# Altium schematic sheet Sensor2_MS5611.SchDoc: Sensors - Barometer 2 MS5611 (SPI5)
size A3; ApprovedBy: Weymen Koo; CheckedBy: -; DrawnBy: Weymen Koo; DocumentNumber: UBCAD-FCSOM-SCH; Revision: A; SheetNumber: 8; SheetTotal: 18; ProjectTitle: Flight Controller SoM; Status: PRELIMINARY; ReleaseDate: 2026-11-14
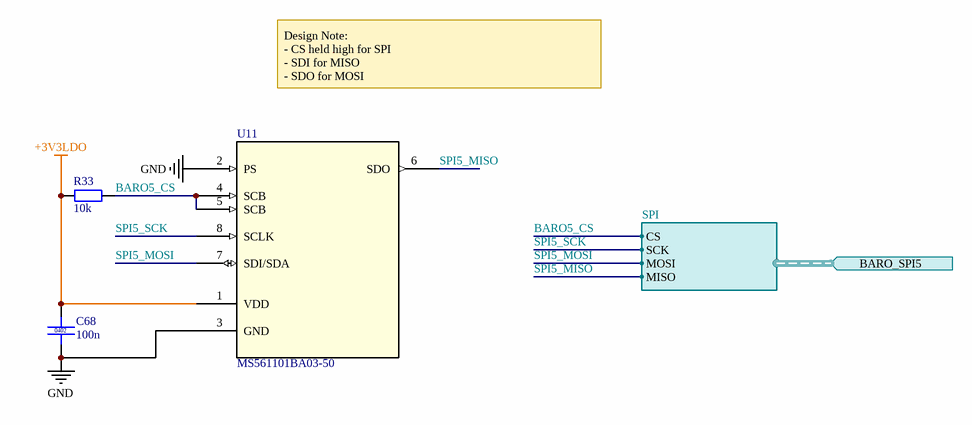
[diagram p0: Sensor2_MS5611.SchDoc]

## Parts
C68  100n  [CAPC1005X05N]
R33  10k  [IPC C R0402 NO SILK]
U11  MS561101BA03-50  [SON8_MS5611_TEC]

## Ports
BARO_SPI5 (in, harness SPI, see 1[5B], 4[5C])

## Harnesses
SPI: CS, SCK, MOSI, MISO

## Nets
+3V3LDO: C68.1 R33.1 U11.1(VDD)
GND: C68.2 U11.2(PS) U11.3(GND)
BARO5_CS: R33.2 U11.4(SCB) U11.5(SCB) ; port BARO_SPI5.CS
SPI5_MISO: U11.6(SDO) ; port BARO_SPI5.MISO
SPI5_MOSI: U11.7(SDI/SDA) ; port BARO_SPI5.MOSI
SPI5_SCK: U11.8(SCLK) ; port BARO_SPI5.SCK

## Notes on the sheet
- Design Note:
  - CS held high for SPI
  - SDI for MISO
  - SDO for MOSI
  - SCLK for SCK
- PROJECT
- KEY
- POWER
- 5 V class
- 3.3 V class
- Core / SMPS
- GND
- SHEET TITLE
- SIGNALS
- NOTES
- SPI
- Analog
- Design
- I2C
- PWM/Timer
- Layout
- UART/RC
- GPIO/Ctrl
- Assembly
- CAN
- Unused pin
- Firmware
- USB/SD/Clk
- Critical
- DRAWN
- DOCUMENT NO.
- CHECKED
- REV
- STATUS
- APPROVED
- DATE
- FILE
- SIZE
- A3
- SHEET
- of

## Library data of the parts
C68 = CMP-002-000094-5: CAP 100n 16V X7R 10% 0402; Manufacturer: Samsung; Manufacturer Part Number: CL05B104KO5NNNC; Value: 100n; Tolerance: 10%; Package: 0402; Voltage: 16V; Dielectric: X7R; LCSC Part #: C1525
R33 = CMP-008-000000-2: RES 10k 1% 1/16W 0402; Manufacturer: UNI-ROYAL; Manufacturer Part Number: 0402WGF1002TCE; Value: 10k; Source: Schlib1.SchLib; Design Item ID: Generic RES 0402; Package: 0402; Tolerance: 1%; Power: 1/16W; LCSC Part #: C25744
U11 = CMP-325-000000-2: MS5611 BAROMETRIC SENSOR CM T&R; Manufacturer_Name: TE Connectivity; Copyright: Copyright (C) 2026 Ultra Librarian. All rights reserved.; Design Item ID: MS561101BA03-50; RefDes: RefDes; Type: Type; Source: MS561101BA03-50.SchLib; Manufacturer_Part_Number: MS561101BA03-50